# EasyEDA Pro project weather-station.epro

# Schematic Schematic3_1
Board Name: 气象仪; Create Date: 2025-03-03; Page Name: 气象仪; Project Name: tmp; Schematic Name: Schematic3_1; Update Date: 2025-03-03; Company: 嘉立创EDA; Page Size: A4; Version: V1.0
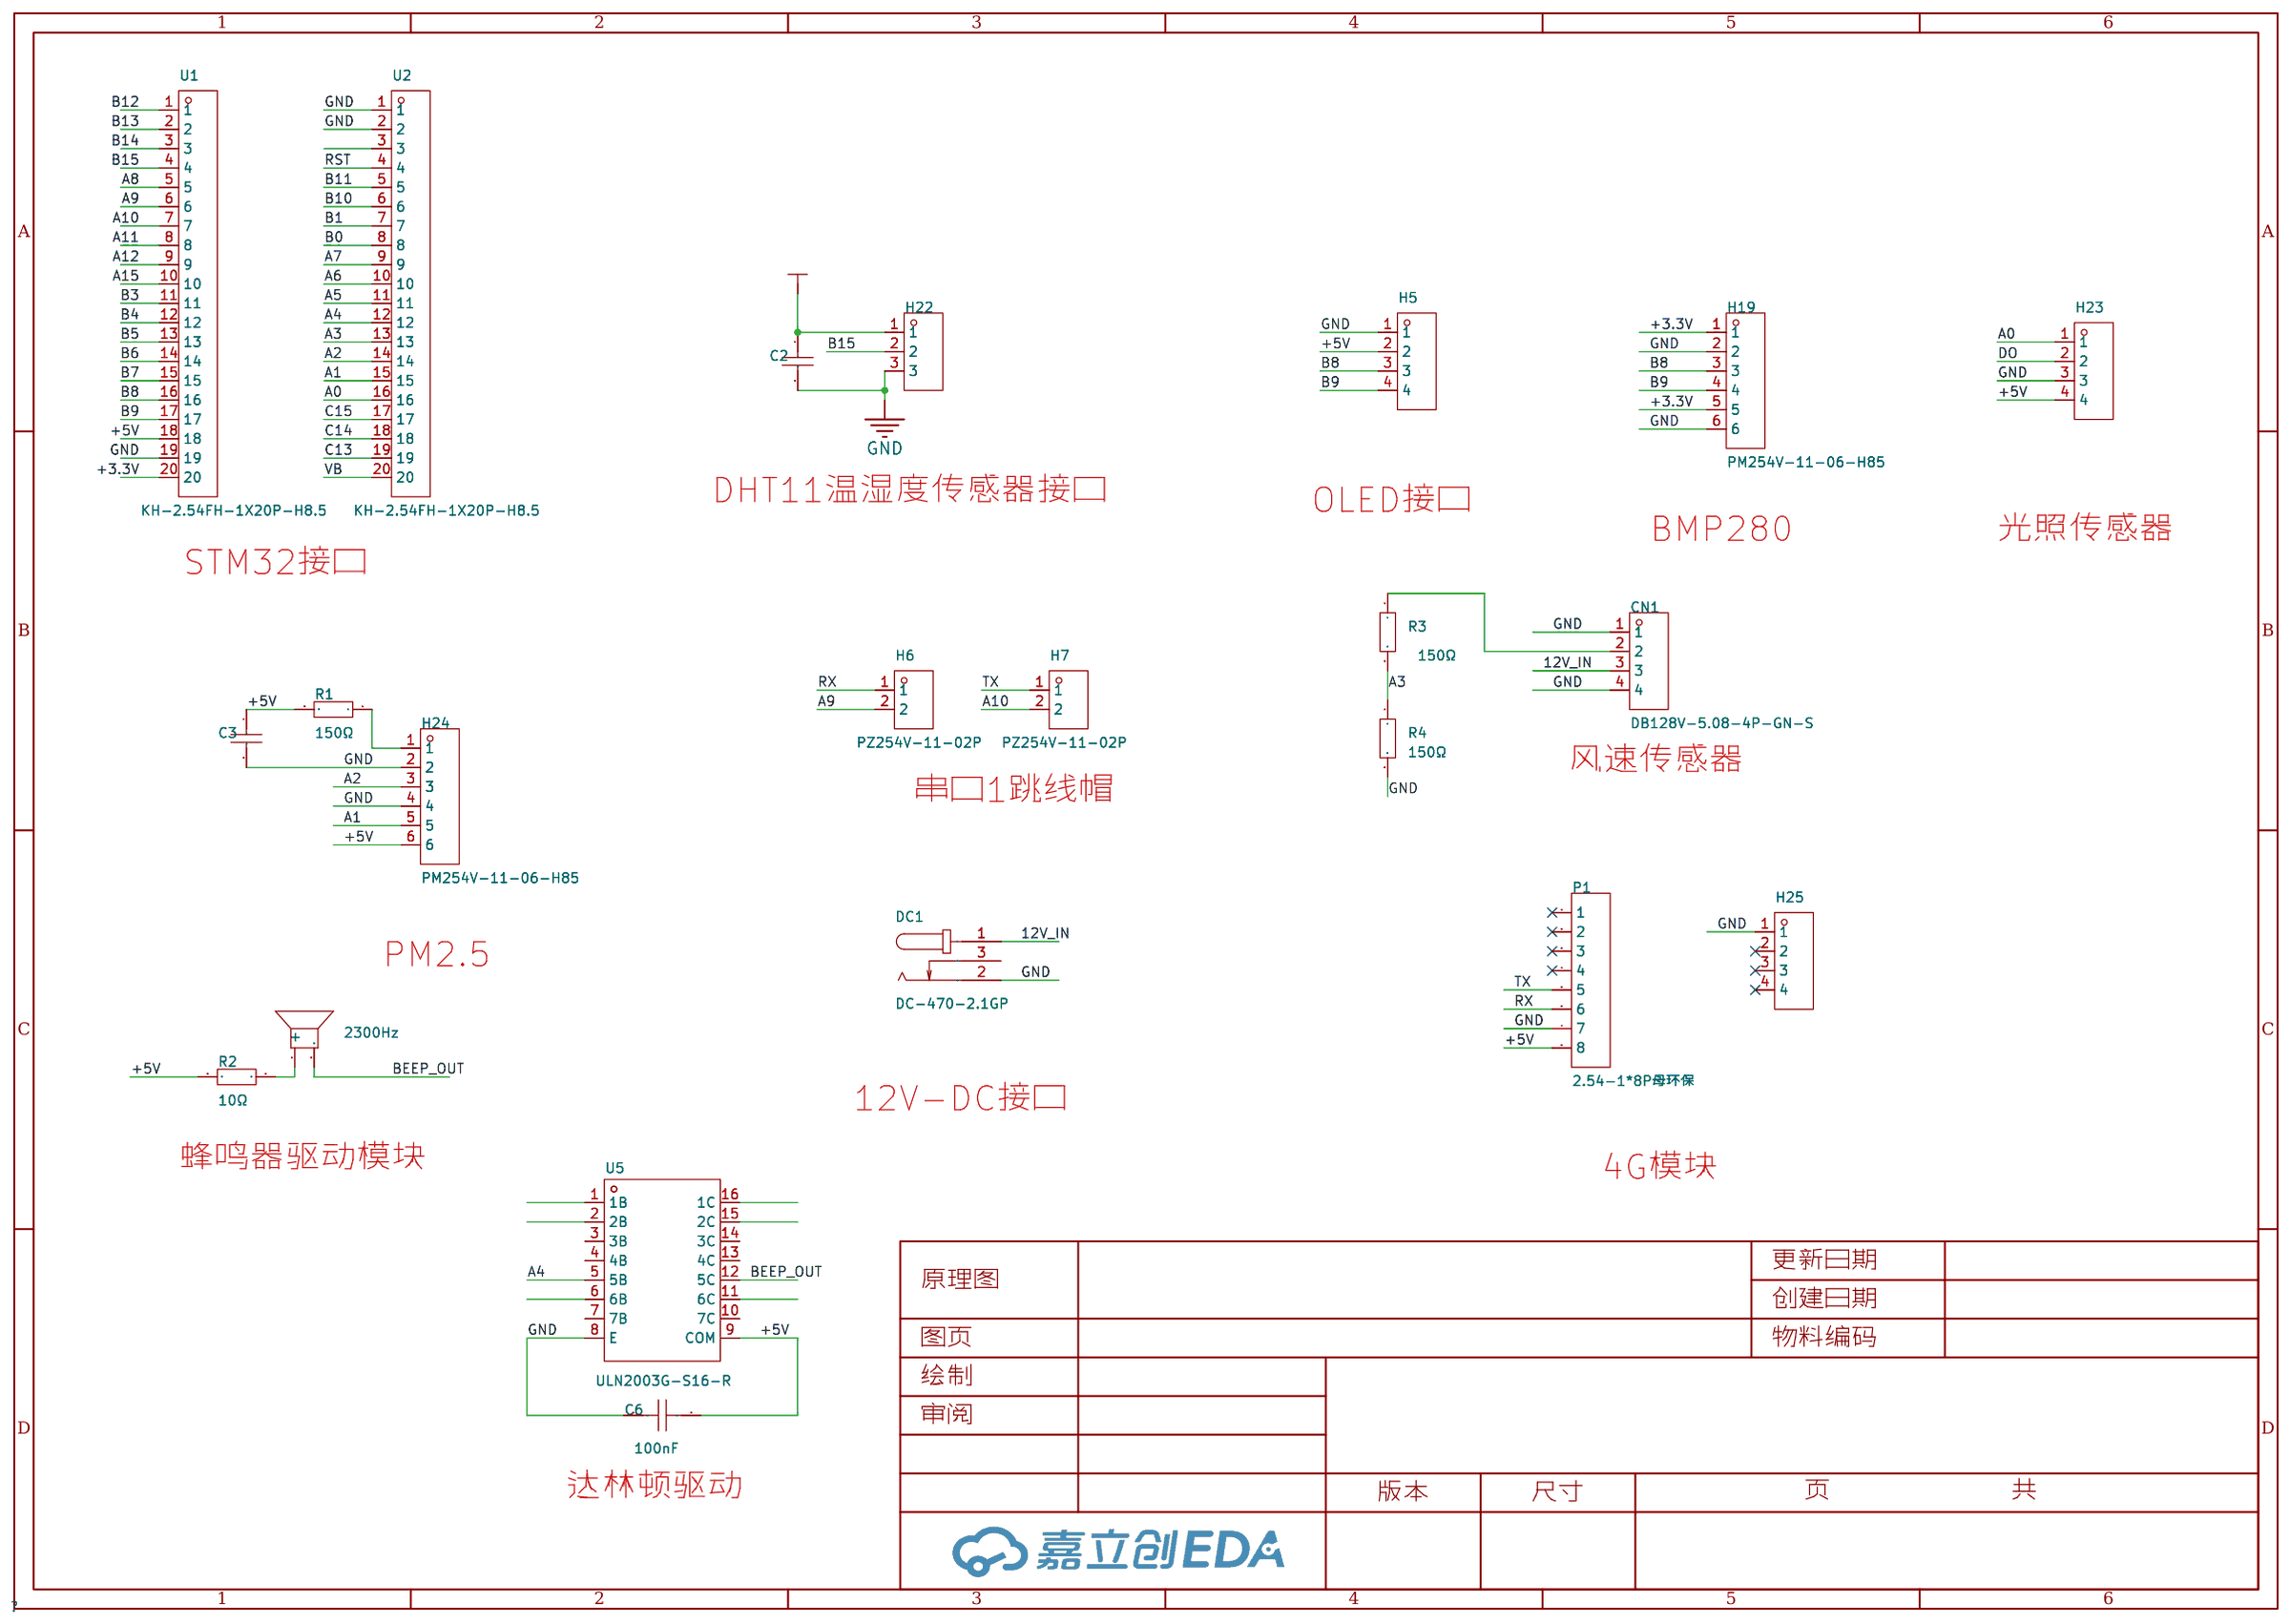
[diagram p0: schematic sheet]

## Parts
BEEP1  2300Hz  [BUZ-TH_BD12.0-P7.60-D0.6-FD]
C2  100nF  [C0805]
C3  100nF  [C0805]
C6  100nF  [C0805]
CN1  DB128V-5.08-4P-GN-S  [CONN-TH_4P-P5.08_DIBO_DB128V-5.08]
DC1  DC-470-2.1GP  [DC-IN-TH_DC-470-2.1GP]
H5  PM2.54-1*4  [HDR-TH_4P-P2.54-V-F]
H6  PZ254V-11-02P  [HDR-TH_2P-P2.54-V-M]
H7  PZ254V-11-02P  [HDR-TH_2P-P2.54-V-M]
H19  PM254V-11-06-H85  [HDR-TH_6P-P2.54-V-F]
H22  PZ254V-11-03P  [HDR-TH_3P-P2.54-V-M]
H23  PM2.54-1*4  [HDR-TH_4P-P2.54-V-F]
H24  PM254V-11-06-H85  [HDR-TH_6P-P2.54-V-F]
H25  PM2.54-1*4  [HDR-TH_4P-P2.54-V-F]
P1  2.54-1*8P母环保  [HDR-TH_8P-P2.54-V-F-1]
R1  150Ω  [R0805_NEW]
R2  10Ω  [R0805_NEW]
R3  150Ω  [R0805_NEW]
R4  150Ω  [R0805_NEW]
U1  KH-2.54FH-1X20P-H8.5  [HDR-TH_20P-P2.54-V-F-2]
U2  KH-2.54FH-1X20P-H8.5  [HDR-TH_20P-P2.54-V-F-2]
U5  ULN2003G-S16-R  [SOIC-16_L9.9-W3.9-P1.27-LS6.0-BL]

## Library data of the parts
BEEP1 = TMB12A03: 驱动方式:有源(内含驱动线路);构造类型:电磁式;额定电压:3V;工作电压:1.5V~4V;频率:2300Hz;声压(SPL):85dB@3V,10cm;直径(φD):12mm;高度:9.8mm;; Supplier Part: C96222; Manufacturer: 华能; Supplier Footprint: 插件,D=12mm; JLCPCB Part Class: Extended Part; Datasheet: https://atta.szlcsc.com/upload/public/pdf/source/20211202/CAFCFF4D10B388AA00F36865319470DA.pdf; Supplier: LCSC; Oscillator Circuit: 有源(内含驱动线路); Technology Type: 电磁式; Rated Voltage: 3V; Operating Voltage: 1.5V~4V; Sound Pressure Level (SPL): 85dB@3V,10cm; Diameter (φD): 12mm; Height: 9.8mm
C2 C3 = CL21B104KBCNNNC: 温度系数:X7R;容值:100nF;精度:±10%;额定电压:50V;; LCSC Part Name: 100nF ±10% 50V; Supplier Part: C1711; Manufacturer: SAMSUNG(三星); Supplier Footprint: 0805; JLCPCB Part Class: Extended Part; Datasheet: https://atta.szlcsc.com/upload/public/pdf/source/20160103/1457707693305.pdf; Supplier: LCSC; Temperature Coefficient: X7R; Tolerance: ±10%; Voltage Rated: 50V
C6 = CC0805KRX7R9BB104: 容值:100nF;精度:±10%;额定电压:50V;材质(温度系数):X7R;; LCSC Part Name: 100nF ±10% 50V; Supplier Part: C49678; Manufacturer: YAGEO(国巨); Supplier Footprint: 0805; JLCPCB Part Class: 基础库; Datasheet: https://atta.szlcsc.com/upload/public/pdf/source/20180224/C181747_15194369449651363981.pdf; Supplier: LCSC; Tolerance: ±10%; Voltage Rated: 50V; Temperature Coefficient: X7R
CN1 = DB128V-5.08-4P-GN-S: 结构:1x4P;间距:5.08mm;颜色:绿色;安装方式:直插;额定电流:20A;额定电压:300V;排数:1;线规 - AWG:12~30;线规 - 平方毫米:2.5;每排PIN数:4;工作温度范围:-40℃~+105℃;; LCSC Part Name: 5.08mm 1x4P 排数:1 每排P数:4 直插; Supplier Part: C2915641; Manufacturer: DORABO(地博电气); Supplier Footprint: 插件,P=5.08mm; JLCPCB Part Class: 扩展库; Datasheet: https://atta.szlcsc.com/upload/public/pdf/source/20230106/CC449C10514519CDCE20F1C37DBF2DAC.pdf; Supplier: LCSC; Structure: 1x4P; Pitch: 5.08mm; Color: 绿色; Mounting Style: 直插; Current Rating (Max): 20A; Voltage Rating (Max): 300V; Number of Pins: 4P; Number of Rows: 1; Wire Gauge - AWG: 12~30; Wire Gauge - mm2: 2.5; Number of PINs Per Row: 4; Operating Temperature Range: -40℃~+105℃
DC1 = DC-470-2.1GP: 连接器类型:DC电源插座;安装方式:弯插;触点内径:2.1mm;触点外径:6.3mm;额定电流:500mA;额定电压:30V;触头材质:-;触头镀层:-;工作温度范围:-40℃~+55℃;焊接温度(最大值):-;; LCSC Part Name: DC电源插座 内径:2.1mm 外径:6.3mm; Supplier Part: C194407; Manufacturer: GANGYUAN(港源); Supplier Footprint: 插件; JLCPCB Part Class: 扩展库; Datasheet: https://atta.szlcsc.com/upload/public/pdf/source/20180622/C194407_A8415BB52DCD8B2707DD756772886C27.pdf; Supplier: LCSC; Connector Type: DC电源插座; Mounting Style: 弯插; Inside Contact Diameter: 2.1mm; Outside Contact Diameter: 6.3mm; Current Rating (Max): 500mA; Voltage Rating (Max): 30V; Operating Temperature Range: -40℃~+55℃
H5 H23 H25 = PM2.54-1*4: 排数:单排;总孔位数:4;间距:2.54mm;插孔结构:1x4P;行距:2.54mm;安装类型:直插;圆孔/方孔:方孔;额定电流:2.5A;插孔方向:顶部;塑高:8.5mm;工作温度范围:-40℃~+105℃;; LCSC Part Name: 2.54mm 1x4P; Supplier Part: C5116530; Manufacturer: ZHOURI(洲日); Supplier Footprint: 插件,P=2.54mm; JLCPCB Part Class: Extended Part; Datasheet: https://atta.szlcsc.com/upload/public/pdf/source/20220729/3385E3C3A9122AF204A83235A2975C64.pdf; Supplier: LCSC; Number of Rows: 单排; Number of Holes: 4; Pitch: 2.54mm; Holes Structure: 1x4P; Row Spacing: 2.54mm; Mounting Type: 直插; Circular Hole / Square Hole: 方孔; Current Rating (Max): 2.5A; Holes Direction: 顶部; Insulation Height: 8.5mm; Operating Temperature Range: -40℃~+105℃
H6 H7 = PZ254V-11-02P: 插针结构:1x2P;间距:2.54mm;行距:-;圆针/方针:方针;安装类型:直插;排数:单排;总PIN位数:2P;额定电流:-;额定电压:-;配合针长度:6mm;塑高:2.5mm;端接针长度:3mm;触头材质:黄铜;触头镀层:-;工作温度范围:-40℃~+105℃;颜色:黑色;; LCSC Part Name: 间距:2.54mm 1x2P 直插 方针; Supplier Part: C492401; Manufacturer: XFCN(兴飞); Supplier Footprint: 插件,P=2.54mm; JLCPCB Part Class: Extended Part; Datasheet: https://atta.szlcsc.com/upload/public/pdf/source/20200309/C492401_A812433581A9B211A7FFA413ADDFF0E5.pdf; Supplier: LCSC; Pin Structure: 1x2P; Pitch: 2.54mm; Circluar Pins/Square Pins: 方针; Mounting Type: 直插; Number of Rows: 单排; Number of Pins: 2P; Length of Mating Pin: 6mm; Insulation Height: 2.5mm; Length of End Connection Pin: 3mm; Contact Material: 黄铜; Operating Temperature Range: -40℃~+105℃; Color: 黑色
H19 H24 = PM254V-11-06-H85: 插孔结构:1x6P;间距:2.54mm;行距:-;圆孔/方孔:方孔;安装类型:直插;排数:单排;总孔位数:6P;额定电流:3A;额定电压:250V;插孔方向:顶部;塑高:-;工作温度范围:-40℃~+105℃;; LCSC Part Name: 间距:2.54mm 1x6P 直插; Supplier Part: C2832269; Manufacturer: XFCN(兴飞); Supplier Footprint: 插件,P=2.54mm; JLCPCB Part Class: 扩展库; Datasheet: https://atta.szlcsc.com/upload/public/pdf/source/20210514/C2832269_B3EC97736B37C2783BDCE3050AA57447.pdf; Supplier: LCSC; Holes Structure: 1x6P; Pitch: 2.54mm; Circular Hole / Square Hole: 方孔; Mounting Type: 直插; Number of Rows: 单排; Number of Holes: 6P; Current Rating (Max): 3A; Voltage Rating (Max): 250V; Holes Direction: 顶部; Operating Temperature Range: -40℃~+105℃
H22 = PZ254V-11-03P: 插针结构:1x3P;间距:2.54mm;行距:-;圆针/方针:方针;安装类型:直插;排数:单排;总PIN位数:3P;额定电流:3A;额定电压:250V;配合针长度:6mm;塑高:2.5mm;端接针长度:3mm;工作温度范围:-40℃~+105℃;颜色:黑色;; LCSC Part Name: 间距:2.54mm 1x3P 直插 方针; Supplier Part: C2937625; Manufacturer: XFCN(兴飞); Supplier Footprint: 插件,P=2.54mm; JLCPCB Part Class: 扩展库; Datasheet: https://atta.szlcsc.com/upload/public/pdf/source/20200309/C492402_8335C3D49C4E4C618838D59BB1D024C1.pdf; Supplier: LCSC; Pin Structure: 1x3P; Pitch: 2.54mm; Circluar Pins/Square Pins: 方针; Mounting Type: 直插; Number of Rows: 单排; Number of Pins: 3P; Current Rating (Max): 3A; Voltage Rating (Max): 250V; Length of Mating Pin: 6mm; Insulation Height: 2.5mm; Length of End Connection Pin: 3mm; Operating Temperature Range: -40℃~+105℃; Color: 黑色
P1 = 2.54-1*8P母环保: 插孔结构:1x8P;间距:2.54mm;行距:-;安装类型:直插;排数:单排;总孔位数:8P;塑高:-;触头材质:-;触头镀层:-;; LCSC Part Name: 间距:2.54mm 1x8P 直插; Supplier Part: C27438; Manufacturer: BOOMELE(博穆精密); Supplier Footprint: 插件,P=2.54mm; JLCPCB Part Class: 扩展库; Datasheet: https://atta.szlcsc.com/upload/public/pdf/source/20231221/1CA800C6799ED97958773716FAA1BFFE.pdf; Supplier: LCSC; Holes Structure: 1x8P; Pitch: 2.54mm; Mounting Type: 直插; Number of Rows: 单排; Number of Holes: 8P
R1-R4 = 0805W8F100JT5E: 电阻类型:厚膜电阻;阻值:10Ω;精度:±1%;功率:125mW;最大工作电压:150V;温度系数:±200ppm/℃;; LCSC Part Name: 10Ω ±1% 125mW 厚膜电阻; Supplier Part: C17415; Manufacturer: UNI-ROYAL(厚声); Supplier Footprint: 0805; JLCPCB Part Class: 基础库; Datasheet: https://atta.szlcsc.com/upload/public/pdf/source/20200306/C422600_1E6D84923E4A46A82E41ADD87F860B5C.pdf; Supplier: LCSC; Type: 厚膜电阻; Tolerance: ±1%; Power(Watts): 125mW; Overload Voltage (Max): 150V; Temperature Coefficient: ±200ppm/℃; Operating Temperature Range: -55℃~+155℃
U1 U2 = KH-2.54FH-1X20P-H8.5: 排数:单排;总孔位数:20;间距:2.54mm;插孔结构:1x20P;行距:-;安装类型:直插;圆孔/方孔:方孔;额定电流:3A;额定电压:-;插孔方向:顶部;塑高:8.5mm;工作温度范围:-40℃~+105℃;; LCSC Part Name: 2.54mm 1x20P; Supplier Part: C2905423; Manufacturer: kinghelm(金航标); Supplier Footprint: 插件,P=2.54mm; JLCPCB Part Class: Extended Part; Datasheet: https://atta.szlcsc.com/upload/public/pdf/source/20211019/BDB673907948473CE61C8A1CF06C5BF5.pdf; Supplier: LCSC; Number of Rows: 单排; Number of Holes: 20; Pitch: 2.54mm; Holes Structure: 1x20P; Mounting Type: 直插; Circular Hole / Square Hole: 方孔; Current Rating (Max): 3A; Holes Direction: 顶部; Insulation Height: 8.5mm; Operating Temperature Range: -40℃~+105℃
U5 = ULN2003G-S16-R: 通道数:七路;; Supplier Part: C73286; Manufacturer: UTC(友顺); Supplier Footprint: SOIC-16; JLCPCB Part Class: 扩展库; Datasheet: https://atta.szlcsc.com/upload/public/pdf/source/20170105/1483610775540.pdf; Supplier: LCSC; number of channels: 七路

## Nets
12V_IN: CN1.3 DC1.1
+3.3V: H19.1 H19.5 U1.20
+5V: C2.1 C3.1 C6.1 H5.2 H22.1 H23.4 H24.6 P1.8 R1.2 R2.2 U1.18 U5.9(COM)
GND: C2.2 C3.2 C6.2 CN1.1 CN1.4 DC1.2 H5.1 H19.2 H19.6 H22.3 H23.3 H24.2 H24.4 H25.1 P1.7 R4.2 U1.19 U2.1 U2.2 U5.8(E)
A0: H23.1 U2.16
A1: H24.5 U2.15
A2: H24.3 U2.14
A3: R3.2 R4.1 U2.13
A4: U2.12 U5.5(5B)
A5: U2.11
A6: U2.10
A7: U2.9
A8: U1.5
A9: H6.2 U1.6
A10: H7.2 U1.7
A11: U1.8
A12: U1.9
A15: U1.10
B0: U2.8
B1: U2.7
B3: U1.11
B4: U1.12
B5: U1.13
B6: U1.14
B7: U1.15
B8: H5.3 H19.3 U1.16
B9: H5.4 H19.4 U1.17
B10: U2.6
B11: U2.5
B12: U1.1
B13: U1.2
B14: U1.3
B15: H22.2 U1.4
BEEP_OUT: BEEP1.2 U5.12(5C)
C13: U2.19
C14: U2.18
C15: U2.17
DO: H23.2
RST: U2.4
RX: H6.1 P1.6
TX: H7.1 P1.5
VB: U2.20
$2N12426: H24.1 R1.1
$2N13203: BEEP1.1(+) R2.1
$2N13987: CN1.2 R3.1

Not connected (* = marked no-connect by the designer): DC1 3; H25 2* 3* 4*; P1 1* 2* 3* 4*; U2 3; U5 1(1B) 2(2B) 3(3B) 4(4B) 6(6B) 7(7B) 10(7C) 11(6C) 13(4C) 14(3C) 15(2C) 16(1C)

## Notes on the sheet
- DHT11温湿度传感器接口
- OLED接口
- BMP280
- 光照传感器
- STM32接口
- 风速传感器
- 串口1跳线帽
- PM2.5
- 12V-DC接口
- 蜂鸣器驱动模块
- 4G模块
- 达林顿驱动

# Board 气象仪
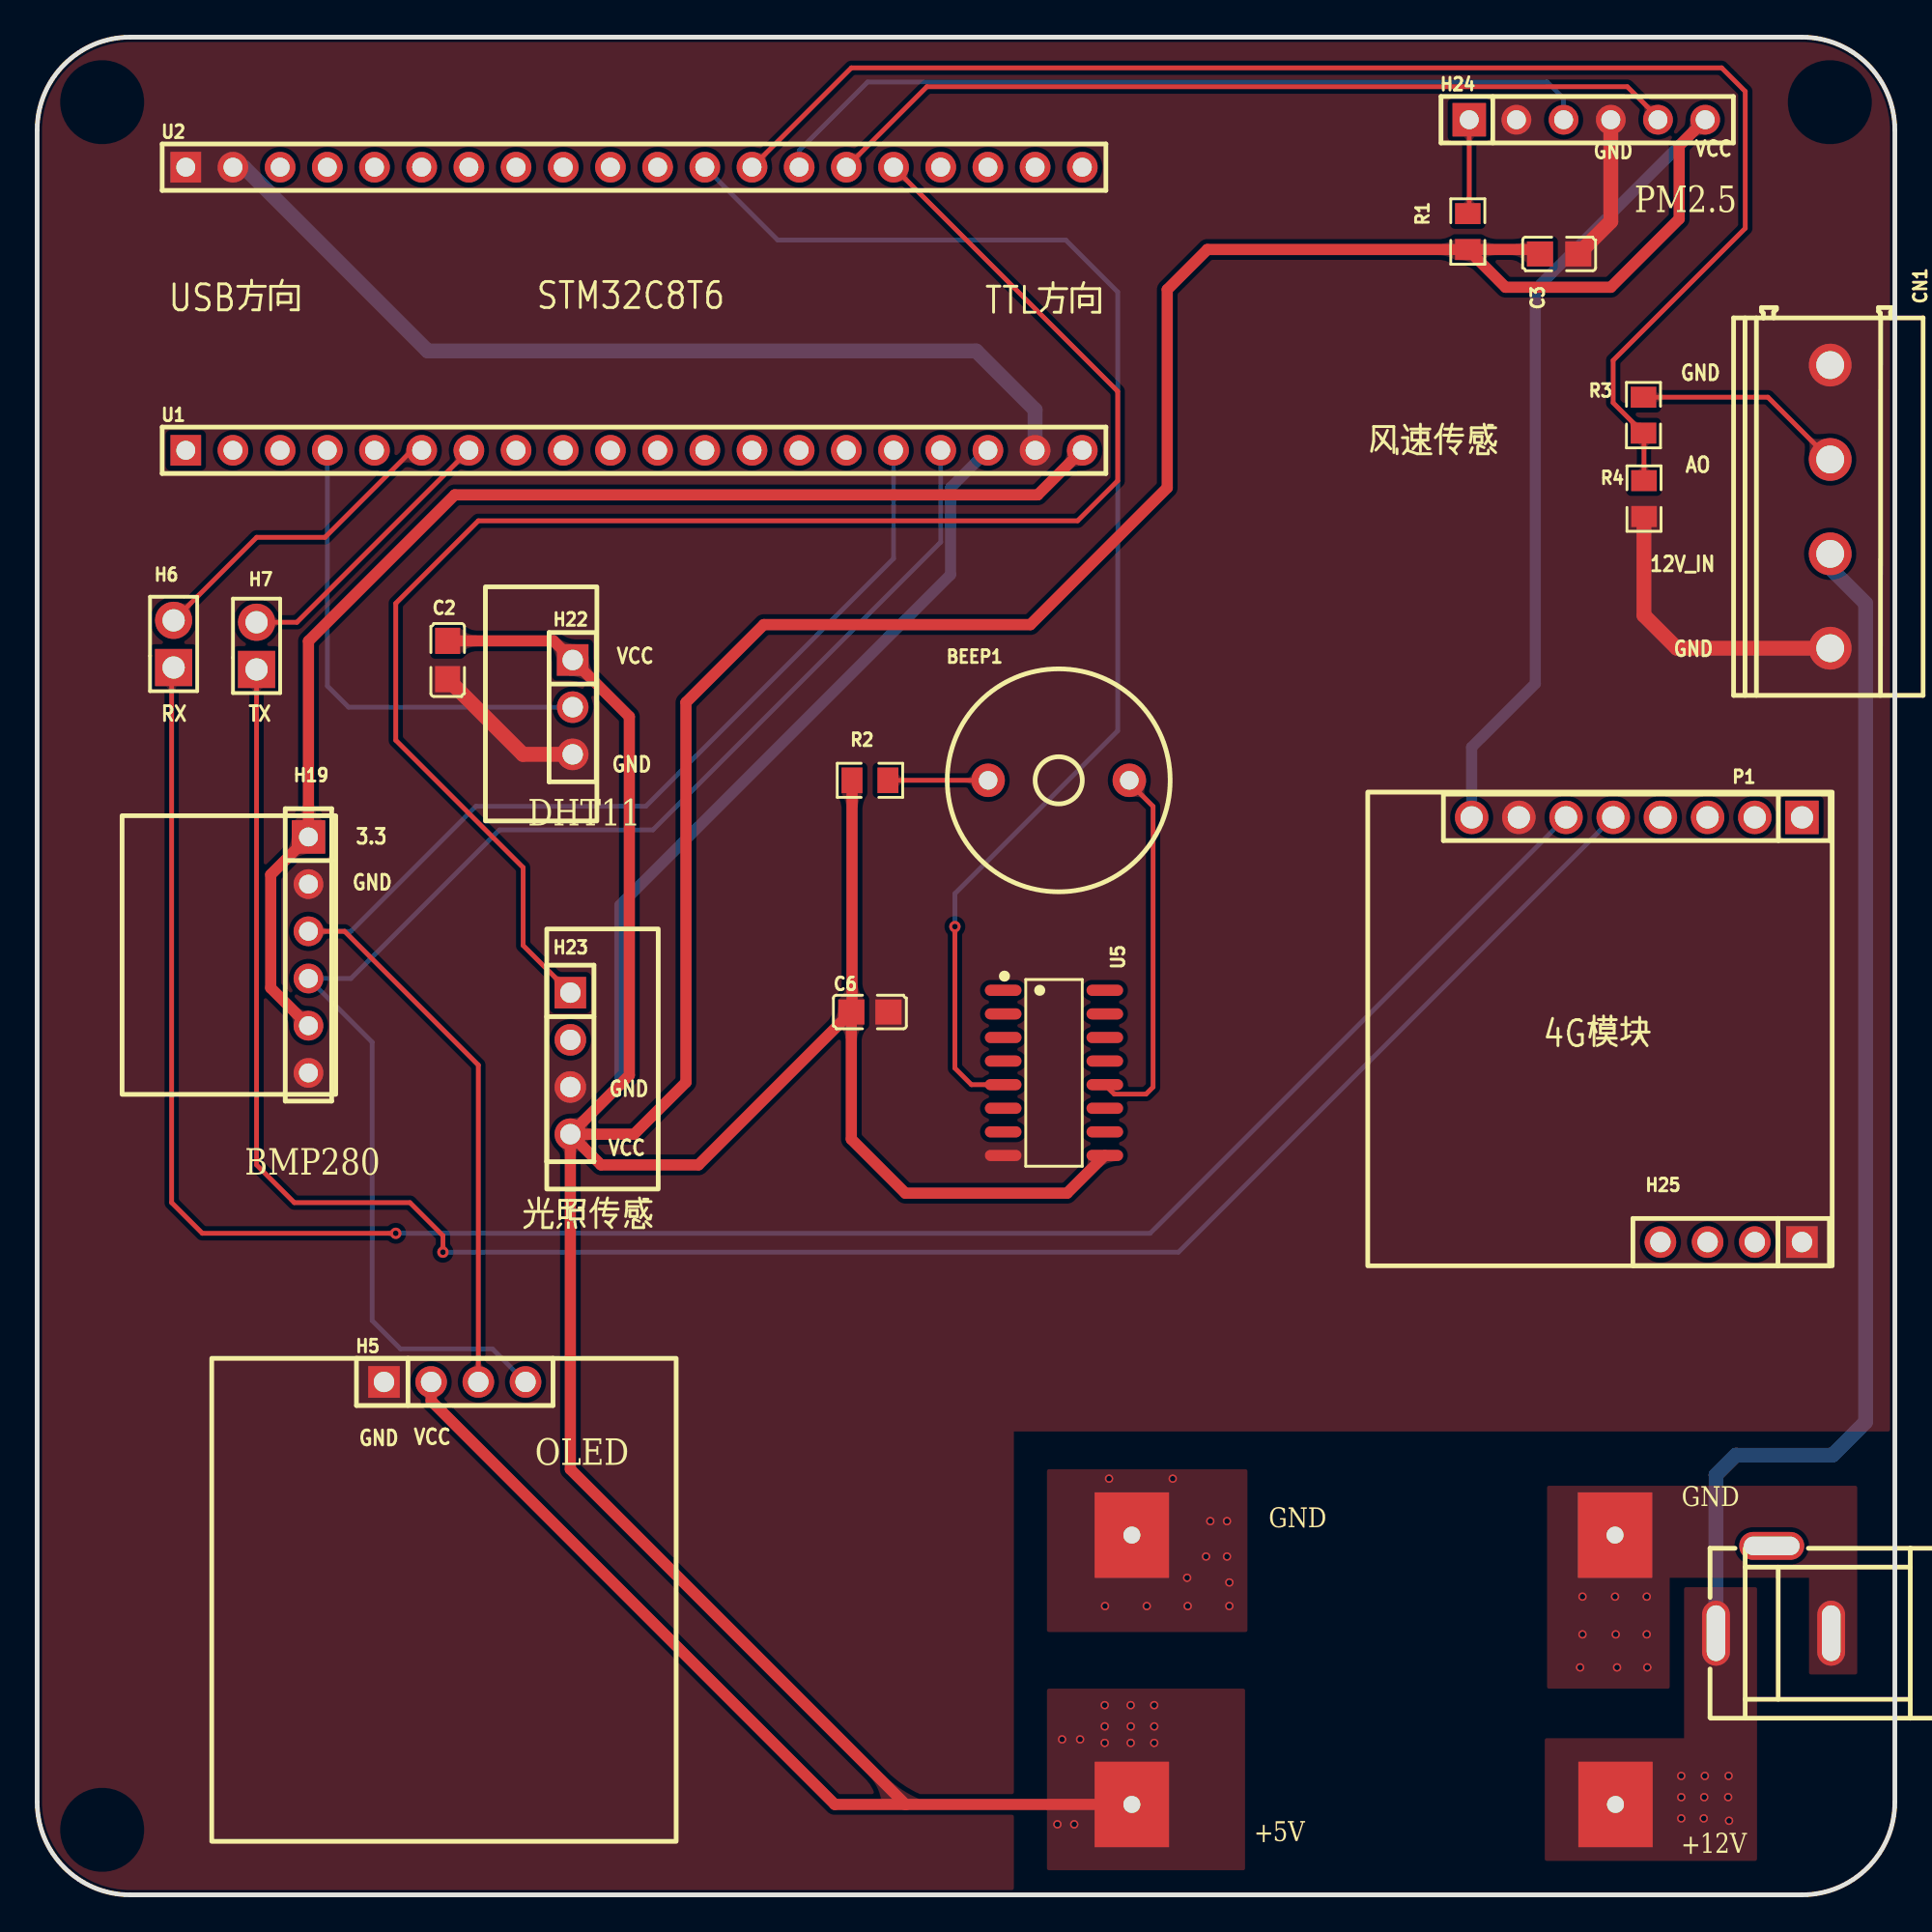
[diagram p1: board, top side]
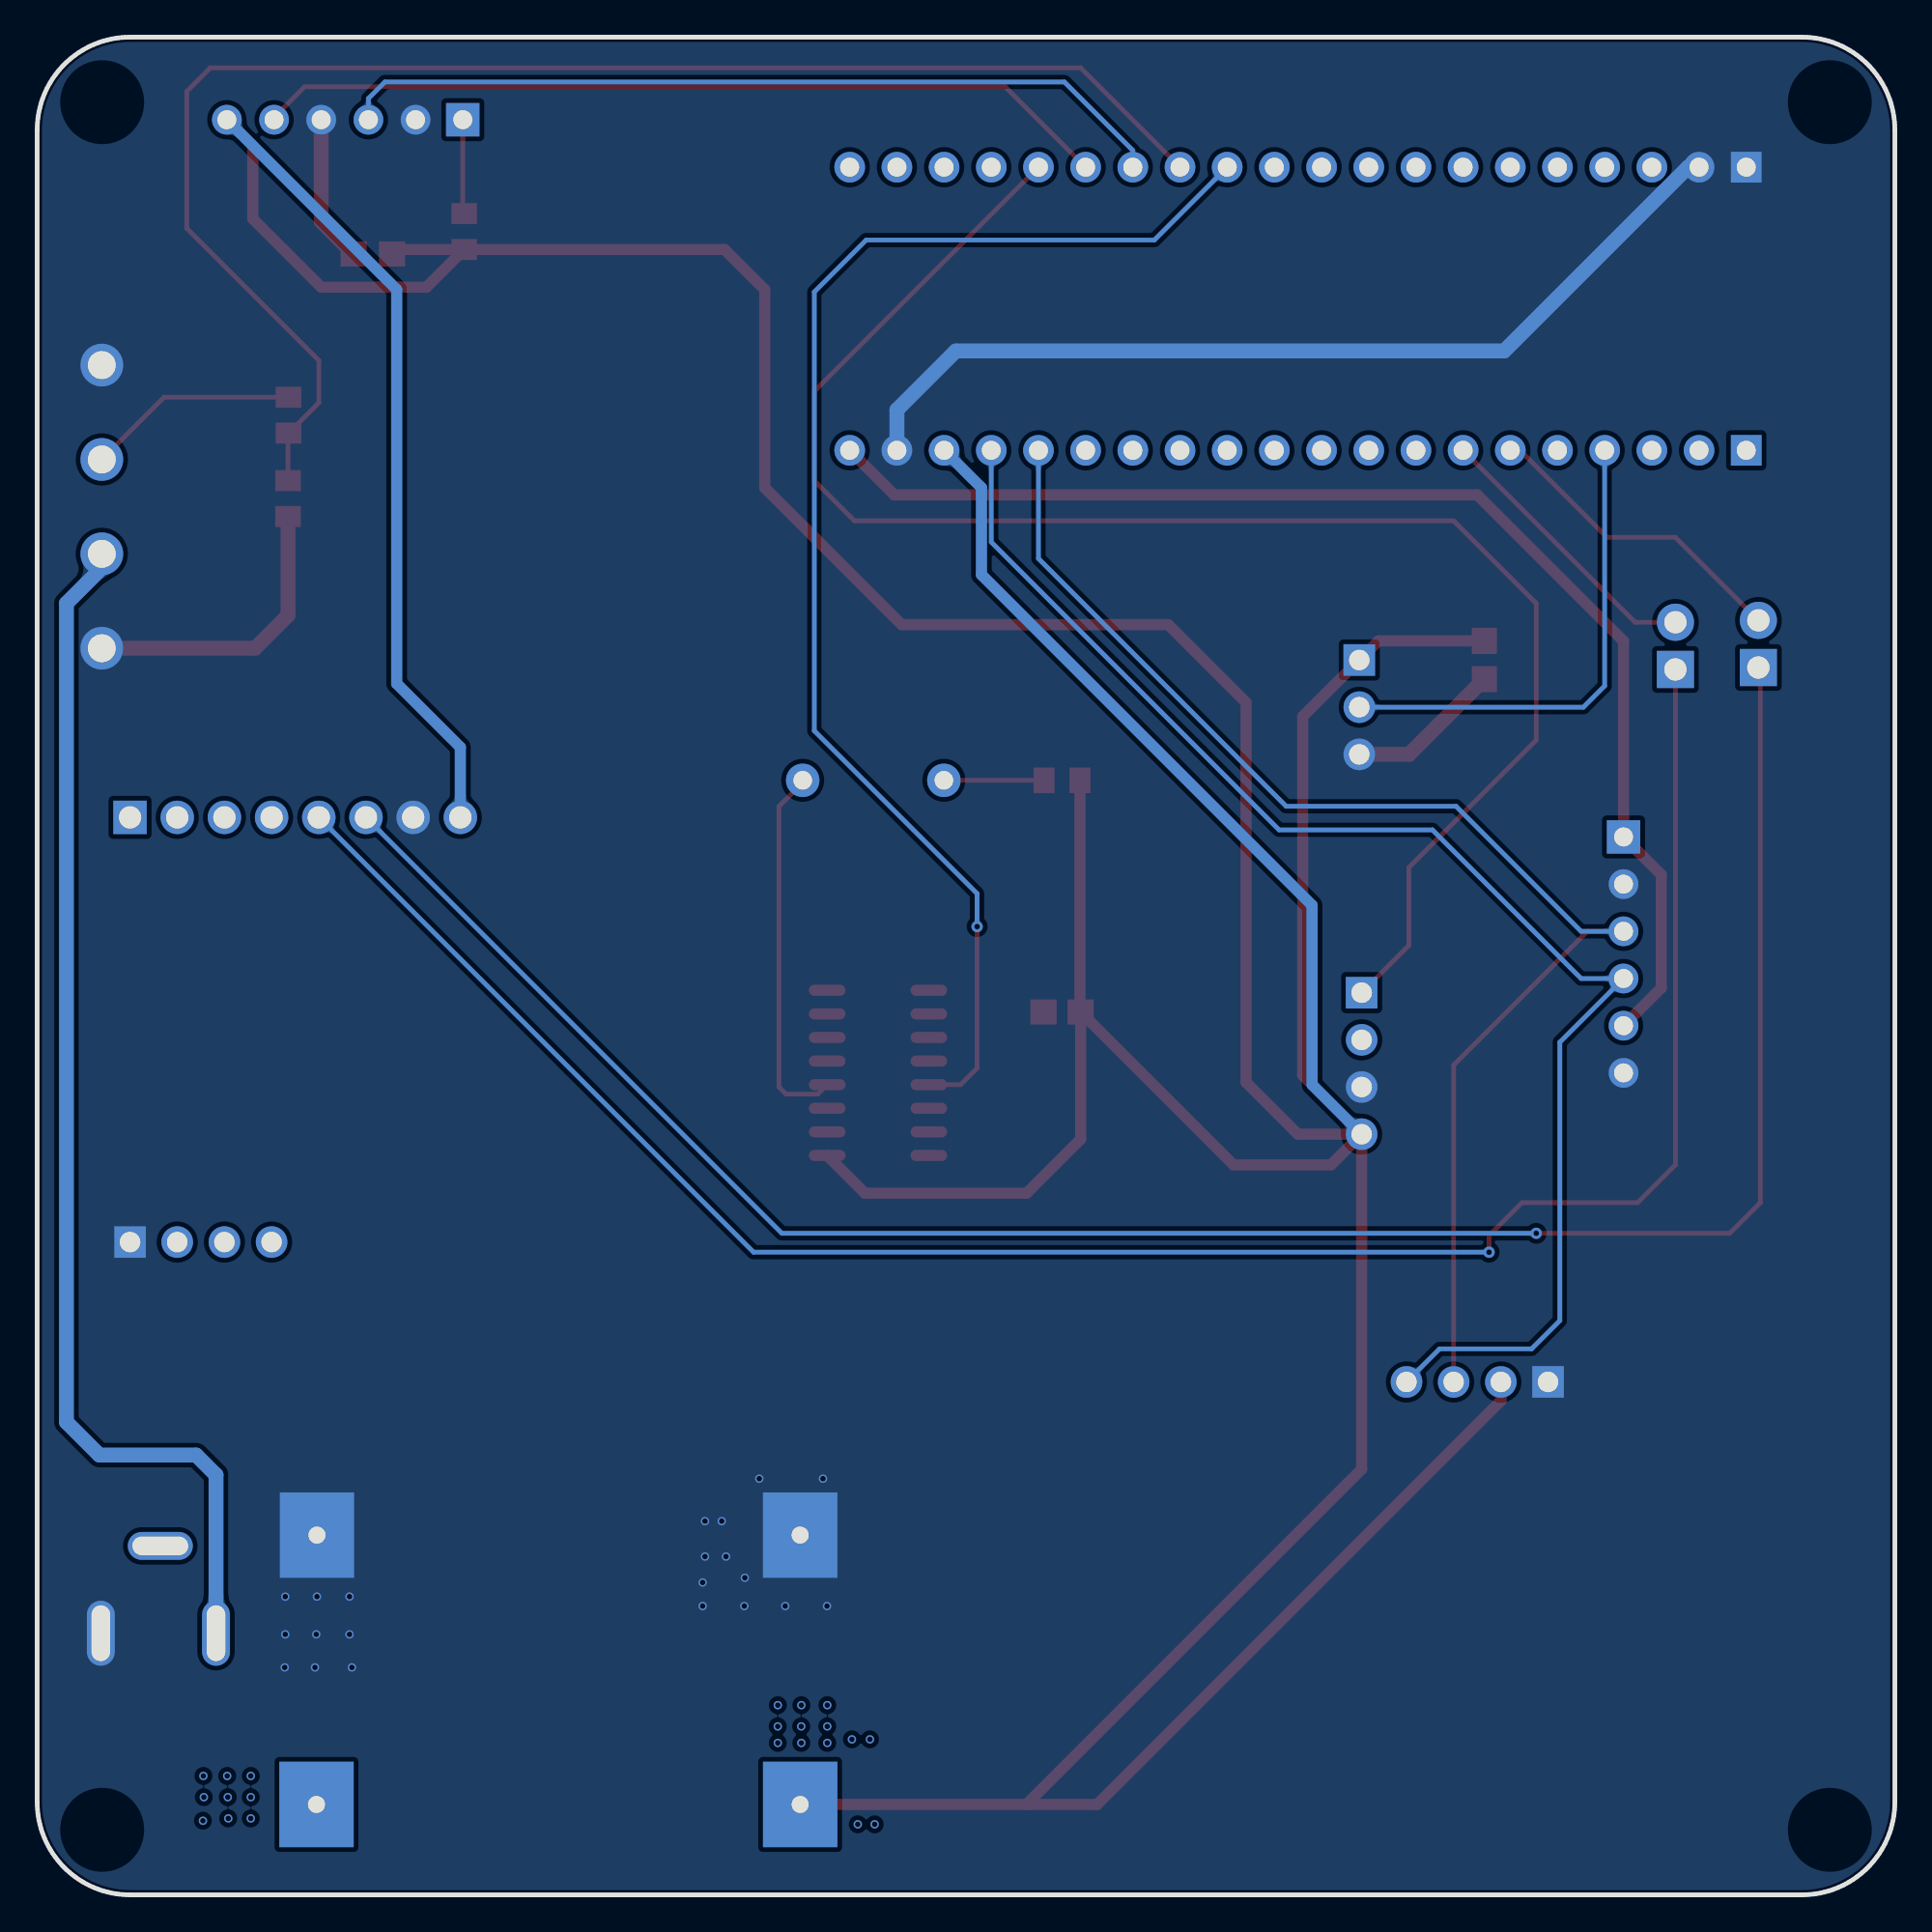
[diagram p2: board, bottom side, seen from below]

Outline 100 x 100 mm; copper layers: Top Layer, Bottom Layer. Coordinates in mm from the lower left corner of the outline.
Outline path: 0,95 0,5 arc(1.46,1.46) 5,0 95,0 arc(98.54,1.46) 100,5 100,95 arc(98.54,98.54) 95,100 5,100 arc(1.46,98.54) 0,95
Stack: Top Layer 0.035mm / Dielectric1 1.51mm FR4 er 4.5 / Bottom Layer 0.035mm

## Design rules (mm)
template: 自定义配置
spacing copperThickness1oz (default): track to track 0.102, other pairs 0.152 to 0.3
spacing copperThickness2oz: track to track 0.203, other pairs 0.152 to 0.3
track width copperThickness1oz (default): min 0.127, default 0.254, max 2.54
track width copperThickness2oz: min 0.203, default 0.254, max 2.54
track width GND: min 0.524, default 0.8, max 2.54
track width POWER: min 0.6, default 0.6, max 2.54
differential pair differentialPair (default): width min 0.127, default 0.254, max 2.54; gap min 0.152, default 0.152
via viaSize (default): diameter min 0.45, default 0.61, max 10; hole min 0.3, default 0.305, max 6.3
net GND uses GND
net +5V uses POWER
net +3.3V uses POWER

## Placement (name value [footprint] x y rotation side)
BEEP1  2300Hz  [BUZ-TH_BD12.0-P7.60-D0.6-FD]  54.99 60 0 top
C2  100nF  [C0805]  22.1 66.47 270 top
C3  100nF  [C0805]  81.93 88.33 0 top
C6  100nF  [C0805#2]  44.83 47.52 0 top
CN1  DB128V-5.08-4P-GN-S  [CONN-TH_4P-P5.08_DIBO_DB128V-5.08]  96.52 74.73 270 top
DC1  DC-470-2.1GP  [DC-IN-TH_DC-470-2.1GP]  93.47 16.43 180 top
H5  PM2.54-1*4  [HDR-TH_4P-P2.54-V-F]  22.48 27.61 0 top
H6  PZ254V-11-02P  [HDR-TH_2P-P2.54-V-M]  7.35 67.34 90 top
H7  PZ254V-11-02P  [HDR-TH_2P-P2.54-V-M]  11.81 67.23 90 top
H19  PM254V-11-06-H85  [HDR-TH_6P-P2.54-V-F]  14.61 50.6 270 top
H22  PZ254V-11-03P  [HDR-TH_3P-P2.54-V-M]  28.83 63.93 270 top
H23  PM2.54-1*4  [HDR-TH_4P-P2.54-V-F]  28.7 44.75 270 top
H24  PM254V-11-06-H85  [HDR-TH_6P-P2.54-V-F]  83.44 95.56 0 top
H25  PM2.54-1*4  [HDR-TH_4P-P2.54-V-F]  91.19 35.14 180 top
NOREF  -  [Pad_e26]  58.93 4.87 0 top
NOREF#2  -  [Pad_e25]  58.93 19.37 0 top
NOREF#3  -  [Pad_e17]  84.96 4.87 0 top
NOREF#4  -  [Pad_e24]  84.94 19.37 0 top
P1  2.54-1*8P母环保  [HDR-TH_8P-P2.54-V-F-1]  86.11 58 180 top
R1  150Ω  [R0805_NEW]  77.01 89.54 270 top
R2  10Ω  [R0805_NEW]  44.83 60 180 top
R3  150Ω  [R0805_NEW]  86.47 79.65 270 top
R4  150Ω  [R0805_NEW]  86.5 75.16 270 top
U1  KH-2.54FH-1X20P-H8.5  [HDR-TH_20P-P2.54-V-F-2]  32.13 77.76 0 top
U2  KH-2.54FH-1X20P-H8.5  [HDR-TH_20P-P2.54-V-F-2]  32.13 93 0 top
U5  ULN2003G-S16-R  [SOIC-16_L9.9-W3.9-P1.27-LS6.0-BL]  54.74 44.25 270 top

## Footprints (pads in the part's own frame, mm; a bottom-side part is the same pattern mirrored in y, then rotated)
BUZ-TH_BD12.0-P7.60-D0.6-FD
  round 1.8 hole 1: 1(-3.8,0) 2(3.8,0)
C0805
  rect 1.41x1.35 smd: 1(-1.03,0) 2(1.03,0)
C0805#2
  rect 1.41x1.35 smd: 1(-1,0) 2(1,0)
CONN-TH_4P-P5.08_DIBO_DB128V-5.08
  round 2.3 hole 1.5: 1(-7.62,0) 2(-2.54,0) 3(2.54,0) 4(7.62,0)
DC-IN-TH_DC-470-2.1GP
  oval 1.5x3.5 hole 1x3: 1(3.1,2.35) 2(-3.1,2.35)
  oval 3.5x1.5 hole 3x1: 3(0.1,-2.35)
HDR-TH_2P-P2.54-V-M
  rect 2x2 hole 1.2: 1(-1.27,0)
  round 2 hole 1.2: 2(1.27,0)
HDR-TH_3P-P2.54-V-M
  rect 1.7x1.7 hole 1.1: 1(-2.54,0)
  round 1.7 hole 1.1: 2(0,0) 3(2.54,0)
HDR-TH_4P-P2.54-V-F
  rect 1.7x1.7 hole 1.1: 1(-3.81,0)
  round 1.7 hole 1.1: 2(-1.27,0) 3(1.27,0) 4(3.81,0)
HDR-TH_6P-P2.54-V-F
  rect 1.8x1.8 hole 1.02: 1(-6.35,0)
  round 1.6 hole 1.02: 2(-3.81,0) 3(-1.27,0) 4(1.27,0) 5(3.81,0) 6(6.35,0)
HDR-TH_8P-P2.54-V-F-1
  rect 1.8x1.8 hole 1.2: 1(-8.89,0)
  round 1.8 hole 1.2: 2(-6.35,0) 3(-3.81,0) 4(-1.27,0) 5(1.27,0) 6(3.81,0) 7(6.35,0) 8(8.89,0)
HDR-TH_20P-P2.54-V-F-2
  rect 1.65x1.65 hole 1.02: 1(-24.13,0)
  round 1.65 hole 1.02: 2(-21.59,0) 3(-19.05,0) 4(-16.51,0) 5(-13.97,0) 6(-11.43,0) 7(-8.89,0) 8(-6.35,0) 9(-3.81,0) 10(-1.27,0) 11(1.27,0) 12(3.81,0) 13(6.35,0) 14(8.89,0) 15(11.43,0) 16(13.97,0) 17(16.51,0) 18(19.05,0) 19(21.59,0) 20(24.13,0)
Pad_e17
  rect 4x4.6 hole 0.914: 3(0,0)
Pad_e24
  rect 4x4.6 hole 0.914: 3(0,0)
Pad_e25
  rect 4x4.6 hole 0.914: 3(0,0)
Pad_e26
  rect 4x4.6 hole 0.914: 3(0,0)
R0805_NEW
  rect 1.133x1.377 smd: 1(-0.966,0) 2(0.966,0)
SOIC-16_L9.9-W3.9-P1.27-LS6.0-BL
  oval 0.602x1.971 smd: 1(-4.445,-2.736) 2(-3.175,-2.736) 3(-1.905,-2.736) 4(-0.635,-2.736) 5(0.635,-2.736) 6(1.905,-2.736) 7(3.175,-2.736) 8(4.445,-2.736) 9(4.445,2.736) 10(3.175,2.736) 11(1.905,2.736) 12(0.635,2.736) 13(-0.635,2.736) 14(-1.905,2.736) 15(-3.175,2.736) 16(-4.445,2.736)

## Nets
As in the schematic, except:
12V_IN: CN1.3 DC1.1 NOREF#3.3
+5V: C2.1 C3.1 C6.1 H5.2 H22.1 H23.4 H24.6 NOREF.3 P1.8 R1.2 R2.2 U1.18 U5.9
GND: C2.2 C3.2 C6.2 CN1.1 CN1.4 DC1.2 H5.1 H19.2 H19.6 H22.3 H23.3 H24.2 H24.4 H25.1 NOREF#2.3 NOREF#4.3 P1.7 R4.2 U1.19 U2.1 U2.2 U5.8

Pads without a net: DC1 3; H25 2 3 4; P1 1 2 3 4; U5 3 4 7 10 13 14

## Via types
v1: diameter 0.61, hole 0.305, Top Layer to Bottom Layer, 3 vias
v2: diameter 0.45, hole 0.3, Top Layer to Bottom Layer, 43 vias

## Routing (per net, layer and track width the routed paths; a pad name or vN(x,y) marks a point on that pad's centre or on a via; arc(x,y) is an arc through that point)
12V_IN: length 65.3
  Bottom Layer w0.8: DC1.1 90.37,22.6 91.44,23.67 96.65,23.67 98.43,25.45 98.43,69.52 96.52,71.42 CN1.3
  vias: v2(88.5,6.4) v2(88.5,5.26) v2(88.5,4.12) v2(89.74,5.26) v2(89.71,4.12) v2(89.77,6.4) v2(91.03,5.26) v2(91.05,6.4) v2(91.08,3.99)
+3.3V: length 68.3
  Top Layer w0.6: U1.20 53.86,75.36 22.48,75.36 14.61,67.49 14.61,56.95 12.57,54.92 12.57,48.82 14.61,46.79
+5V: length 379.6
  Top Layer w0.6: C3.1 80.66,88.57 R1.2 ; H23.4 31.88,44.12 31.88,63.42 H22.1 27.8,67.5 C2.1 ; H23.4 30.35,39.29 35.6,39.29 C6.1 ; H23.4 32.13,40.94 34.93,43.74 34.93,64.19 39.12,68.38 53.47,68.38 60.83,75.74 60.83,86.41 62.99,88.57 R1.2 ; H23.4 28.7,22.91 46.75,4.87 ; U5.9 55.44,37.77 46.74,37.77 43.83,40.68 C6.1 ; R1.2 79.04,86.54 84.71,86.54 88.39,90.22 88.39,94.16 H24.6 ; 46.75,4.87 NOREF.3 ; 46.75,4.87 42.94,4.87 21.21,26.59 H5.2 ; C6.1 43.87,47.56 R2.2
  Bottom Layer w0.6: P1.8 77.22,61.78 80.65,65.2 80.65,86.41 H24.6 ; U1.18 49.17,75.75 49.17,71.06 31.37,53.26 31.37,43.61 H23.4
  vias: v2(54.92,3.8) v2(55.17,8.37) v2(55.83,3.8) v2(56.14,8.37) v2(57.47,10.21) v2(57.47,9.07) v2(57.47,8.18) v2(58.86,10.21) v2(58.87,9.07) v2(58.86,8.18) v2(60.13,10.21) v2(60.13,9.07) v2(60.13,8.18)
GND: length 83.2
  Top Layer w0.8: H22.3 26.15,61.39 C2.2 ; CN1.4 88.26,67.11 86.5,68.88 86.5,74.19 ; C3.2 84.71,90.08 H24.4
  Bottom Layer w0.8: U1.19 53.72,79.94 50.55,83.11 21.02,83.11 11.13,93 U2.2
  vias: v2(57.48,15.54) v2(57.7,22.4) v2(59.73,15.54) v2(61.13,22.4) v2(61.9,17.07) v2(61.93,15.54) v2(62.92,18.21) v2(63.15,20.12) v2(64.05,20.12) v2(64.05,18.21) v2(64.18,16.81) v2(64.18,15.54) v2(83.06,12.24) v2(83.19,16.05) v2(83.19,14.02) v2(84.94,16.05) v2(84.98,14.02) v2(85.05,12.24) v2(86.65,16.05) v2(86.65,14.02) v2(86.67,12.24)
A0: length 88.3
  Top Layer w0.254: H23.1 26.16,51.11 26.16,55.3 19.3,62.15 19.3,69.52 23.75,73.97 56.01,73.97 58.17,76.12 58.17,80.93 U2.16
A1: length 46.3
  Top Layer w0.254: U2.15 47.89,97.33 85.6,97.33 87.25,95.68 H24.5
A2: length 44.3
  Bottom Layer w0.254: U2.14 41.02,93.9 44.7,97.59 81.28,97.59 82.17,96.7 82.17,96.32
A3: length 80.8
  Top Layer w0.254: U2.13 43.83,98.35 90.68,98.35 91.95,97.08 91.95,89.71 84.84,82.6 84.84,80.32 R3.2 86.5,78.66 R4.1
A4: length 73.4
  Top Layer w0.254: v1(49.4,52.12) 49.4,44.5 50.29,43.61 U5.5
  Bottom Layer w0.254: U2.12 39.86,89.08 55.37,89.08 58.17,86.28 58.17,62.66 49.4,53.9 v1(49.4,52.12)
A9: length 17.1
  Top Layer w0.254: U1.6 20.18,77.76 15.49,73.08 11.82,73.08 H6.2
A10: length 15.3
  Top Layer w0.254: U1.7 13.98,68.5 H7.2
B8: length 74.8
  Top Layer w0.254: H5.3 23.75,44.67 16.55,51.87 14.61,51.87
  Bottom Layer w0.254: U1.16 46.1,71.93 32.77,58.6 23.62,58.6 16.89,51.87 14.61,51.87
B9: length 78.2
  Bottom Layer w0.254: U1.17 48.64,72.82 33.15,57.33 24.89,57.33 16.89,49.33 H19.4 18.03,45.9 18.03,30.91 19.56,29.39 24.51,29.39 H5.4
B15: length 26.4
  Bottom Layer w0.254: U1.4 15.62,65.08 16.76,63.93 H22.2
BEEP_OUT: length 20
  Top Layer w0.254: BEEP1.2 58.79,59.87 60.07,58.59 60.07,43.48 59.69,43.1 57.98,43.1 U5.12
RX: length 113.9
  Top Layer w0.254: v1(19.3,35.61) 8.89,35.61 7.24,37.26 7.24,65.96 H6.1
  Bottom Layer w0.254: P1.6 59.91,35.61 v1(19.3,35.61)
TX: length 111.9
  Top Layer w0.254: H7.1 11.81,39.29 13.84,37.26 20.07,37.26 21.84,35.48 v1(21.84,34.59)
  Bottom Layer w0.254: v1(21.84,34.59) 61.44,34.59 P1.5
$2N12426: length 5.1
  Top Layer w0.254: R1.1 77.09,90.58 H24.1
$2N13203: length 5.4
  Top Layer w0.254: R2.1 BEEP1.1
$2N13987: length 11.4
  Top Layer w0.254: CN1.2 93.17,80.62 R3.1

## Copper pours and planes (outline as drawn; the poured copper is in the pictures)
12V_IN on Top Layer: 92.58,1.83 92.58,16.56 88.66,16.56 88.66,8.43 81.15,8.43 81.15,1.83
+5V on Top Layer: 54.36,11.1 65.02,11.1 65.02,1.32 54.36,1.32
GND on Top Layer: 81.28,11.1 87.88,11.1 87.88,17.07 95.38,17.07 95.38,11.86 97.98,11.86 97.98,22.02 81.28,22.02
GND on Top Layer: 0,100 100,100 100,0 0,0
GND on Top Layer: 54.36,22.91 65.15,22.91 65.15,14.15 54.36,14.15
GND on Top Layer: 0,0 52.4,0 52.58,0.18 52.58,24.94 100,24.94 100,100 0,100
GND on Bottom Layer: 0,100 100,100 100,0 0,0
GND on Bottom Layer: 0.13,99.87 100.13,99.87 100.13,-0.13 0.13,-0.13

Small or netless copper shapes (teardrops, artwork), in the pictures only: 58 on Top Layer, 24 on Bottom Layer

## Text on the board
Top Silkscreen Layer: RX | TX | GND | 3.3 | VCC | 12V_IN | AO | STM32C8T6 | +5V | +12V | USB方向 | BMP280 | 光照传感 | DHT11 | OLED | TTL方向 | 风速传感 | 4G模块 | PM2.5
